# Altium schematic sheet macropad.SchDoc
size 297 x 209 mm
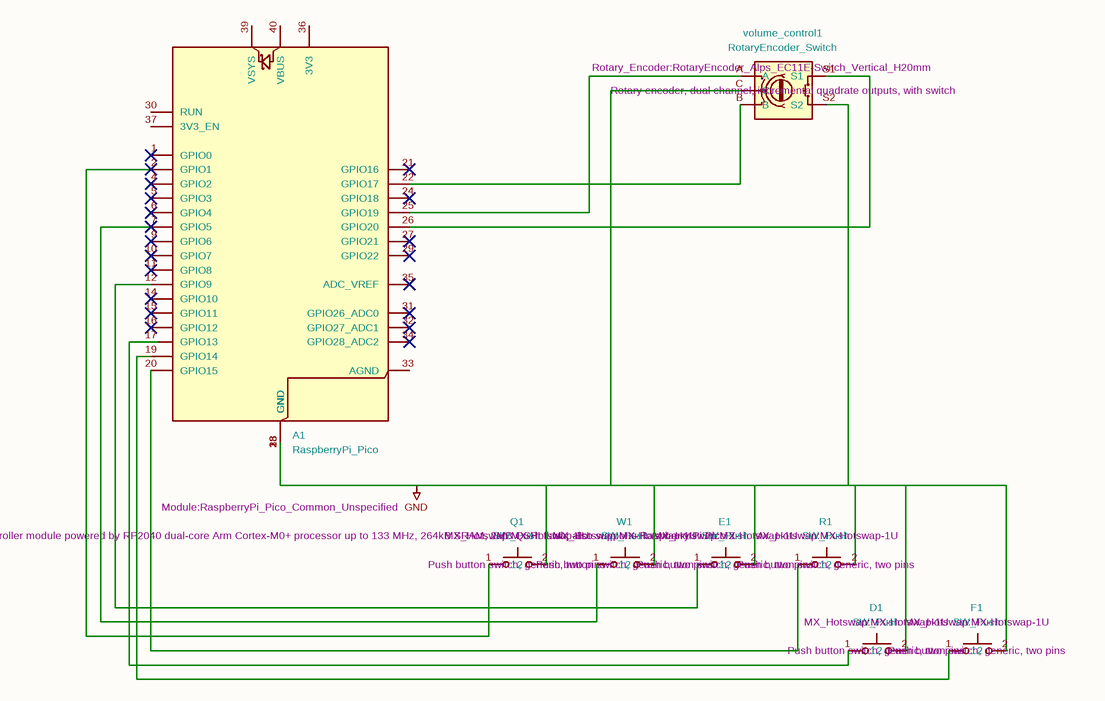
[diagram p0: macropad.SchDoc]

## Parts
A1  Description: Versatile and inexpensive microcontroller module powered by RP2040 dual-core Arm Cortex-M0+ processor up to 133 MHz, 264kB SRAM, 2MB QSPI flash; also supports Raspberry Pi Pico 2  Footprint: Module:RaspberryPi_Pico_Common_Unspecified  [RaspberryPi_Pico_Common_Unspecified]  (hidden comment: RaspberryPi_Pico)
D1  Description: Push button switch, generic, two pins  Footprint: MX_Hotswap:MX-Hotswap-1U  [MX-Hotswap-1U]  (hidden comment: SW_Push)
E1  Description: Push button switch, generic, two pins  Footprint: MX_Hotswap:MX-Hotswap-1U  [MX-Hotswap-1U]  (hidden comment: SW_Push)
F1  Description: Push button switch, generic, two pins  Footprint: MX_Hotswap:MX-Hotswap-1U  [MX-Hotswap-1U]  (hidden comment: SW_Push)
Q1  Description: Push button switch, generic, two pins  Footprint: MX_Hotswap:MX-Hotswap-1U  [MX-Hotswap-1U]  (hidden comment: SW_Push)
R1  Description: Push button switch, generic, two pins  Footprint: MX_Hotswap:MX-Hotswap-1U  [MX-Hotswap-1U]  (hidden comment: SW_Push)
volume_control1  Description: Rotary encoder, dual channel, incremental quadrate outputs, with switch  Footprint: Rotary_Encoder:RotaryEncoder_Alps_EC11E-Switch_Vertical_H20mm  [RotaryEncoder_Alps_EC11E-Switch_Vertical_H20mm]  (hidden comment: RotaryEncoder_Switch)
W1  Description: Push button switch, generic, two pins  Footprint: MX_Hotswap:MX-Hotswap-1U  [MX-Hotswap-1U]  (hidden comment: SW_Push)

## Nets
GND: A1.3(GND) A1.8(GND) A1.13(GND) A1.18(GND) A1.23(GND) A1.28(GND) A1.38(GND) D1.2 E1.2 F1.2 Q1.2 R1.2 volume_control1.C volume_control1.S2 W1.2
NetA1_2: A1.2(GPIO1) Q1.1
NetA1_7: A1.7(GPIO5) W1.1
NetA1_12: A1.12(GPIO9) E1.1
NetA1_17: A1.17(GPIO13) D1.1
NetA1_19: A1.19(GPIO14) F1.1
NetA1_20: A1.20(GPIO15) R1.1
NetA1_22: A1.22(GPIO17) volume_control1.B
NetA1_25: A1.25(GPIO19) volume_control1.A
NetA1_26: A1.26(GPIO20) volume_control1.S1

Not connected (* = marked no-connect by the designer): A1 1(GPIO0)* 4(GPIO2)* 5(GPIO3)* 6(GPIO4)* 9(GPIO6)* 10(GPIO7)* 11(GPIO8)* 14(GPIO10)* 15(GPIO11)* 16(GPIO12)* 21(GPIO16)* 24(GPIO18)* 27(GPIO21)* 29(GPIO22)* 30(RUN) 31(GPIO26_ADC0)* 32(GPIO27_ADC1)* 33(AGND) 34(GPIO28_ADC2)* 35(ADC_VREF)* 36(3V3) 37(3V3_EN) 39(VSYS) 40(VBUS)

## Notes on the sheet
- 1
- 2
- 3
- 4
- 5
- 6
- A
- B
- C
- D
- Title:
- File: macropad.kicad_sch
- Sheet: /
- KiCad E.D.A.  kicad (5.1.4)-1
- Size: A4
- Date:
- Rev:
- Id: 1/1

## Library data of the parts
A1 = RaspberryPi_Pico: Value: RaspberryPi_Pico
D1 E1 F1 Q1 R1 W1 = SW_Push: Value: SW_Push
volume_control1 = RotaryEncoder_Switch: Value: RotaryEncoder_Switch